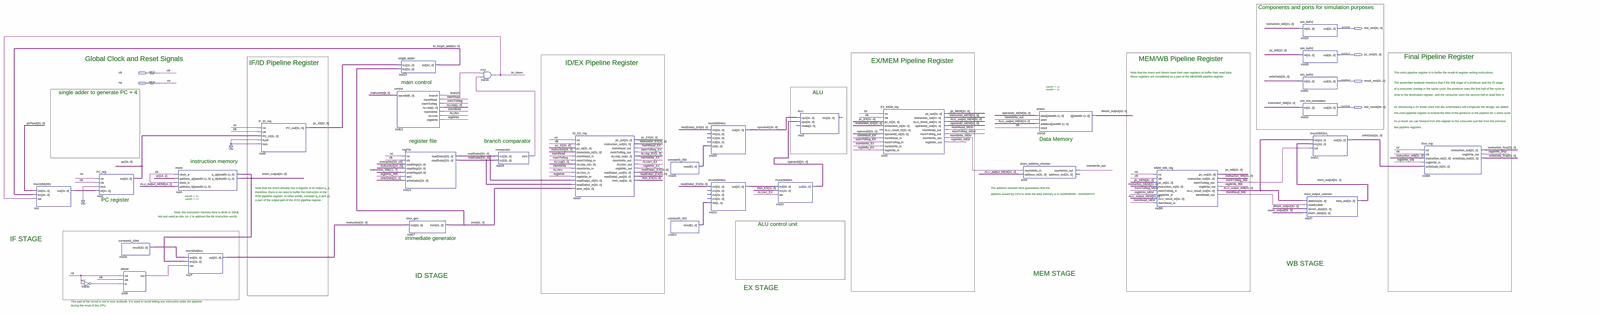
[diagram p0: schematic sheet, whole]
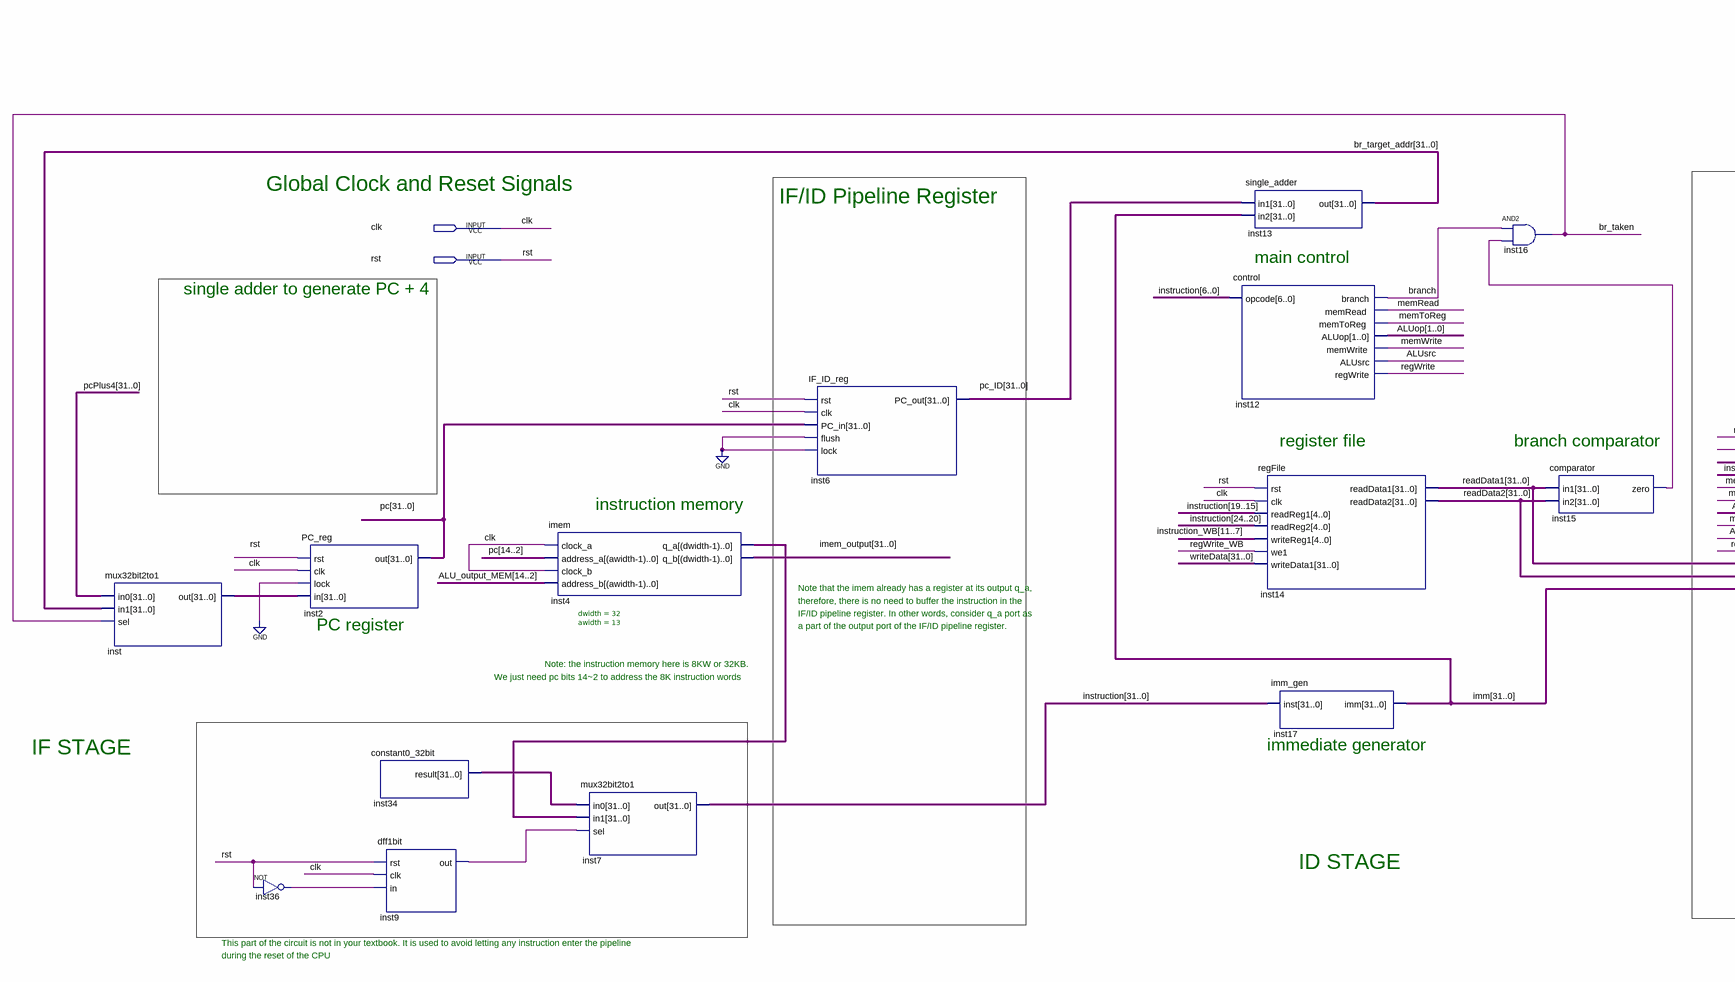
[diagram p1: schematic sheet, left part]
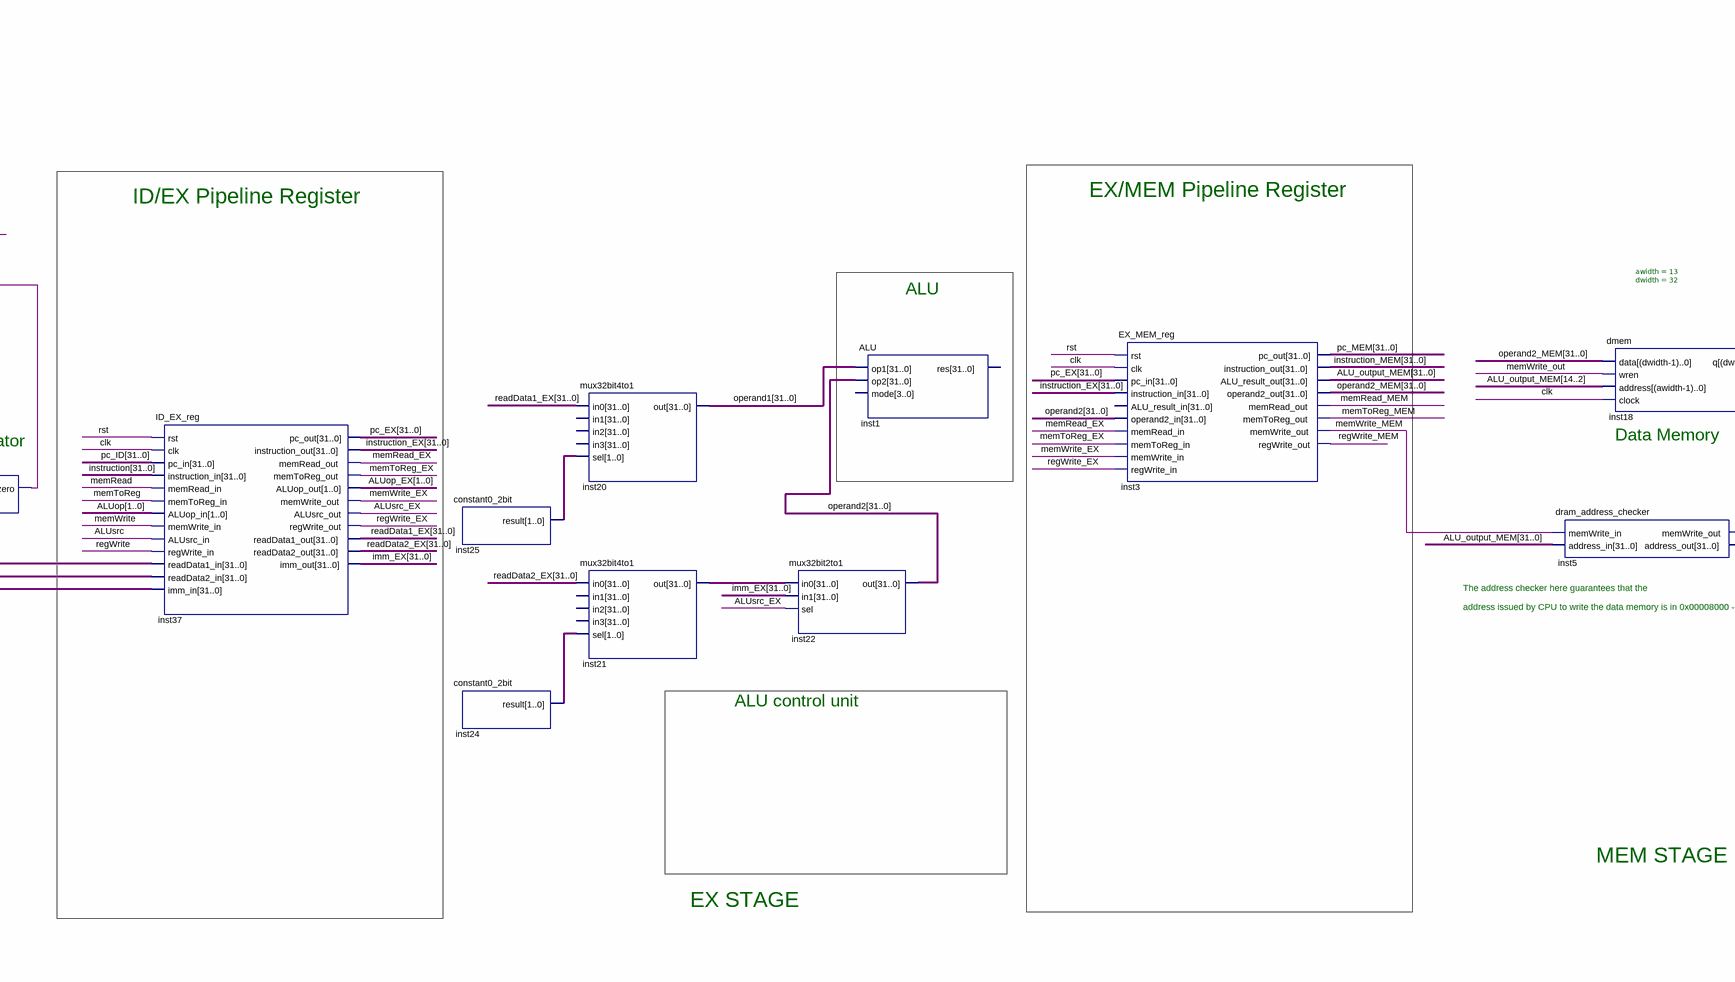
[diagram p2: schematic sheet, centre part]
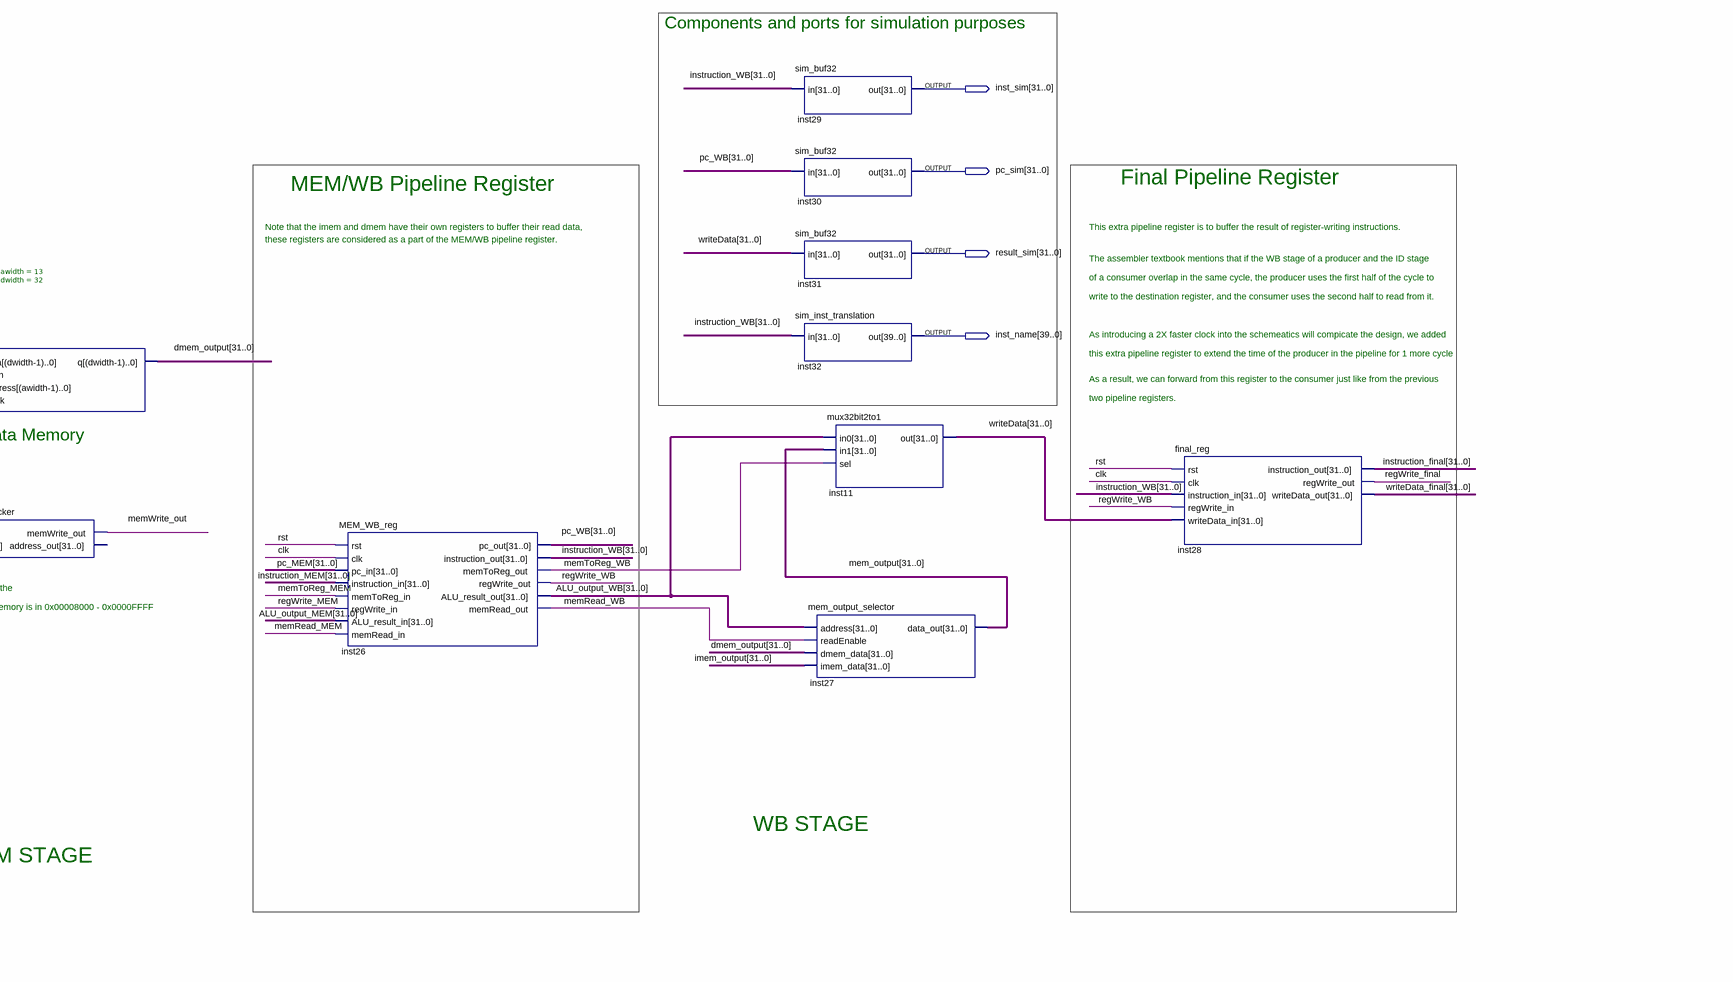
[diagram p3: schematic sheet, right part]
// Quartus schematic cpu.bdf as structural Verilog: 32 symbols, 6 pins
module cpu (
  input  clk,
  input  rst,
  output [31:0] inst_sim,
  output [31:0] pc_sim,
  output [31:0] result_sim,
  output [39:0] inst_name
);

  wire ALUsrc, ALUsrc_EX, br_taken, branch, inst9_out, inst15_zero, inst36_out, memRead, memRead_EX,
       memRead_MEM, memRead_WB, memToReg, memToReg_EX, memToReg_MEM, memToReg_WB, memWrite, memWrite_EX,
       memWrite_MEM, memWrite_out, regWrite, regWrite_EX, regWrite_final, regWrite_MEM, regWrite_WB;
  wire [1:0] ALUop, ALUop_EX, inst24_result, inst25_result;
  wire [31:0] ALU_output_MEM, ALU_output_WB, br_target_addr, dmem_output, imem_output, imm, imm_EX,
       inst4_q_a, inst21_out, inst34_result, inst_out, instruction, instruction_EX, instruction_final,
       instruction_MEM, instruction_WB, mem_output, operand1, operand2, operand2_MEM, pc, pc_EX, pc_ID,
       pc_MEM, pc_WB, pcPlus4, readData1, readData1_EX, readData2, readData2_EX, writeData, writeData_final;

  mux32bit2to1 inst (.in0(pcPlus4), .in1(br_target_addr), .sel(br_taken), .out(inst_out));
  not inst36 (inst36_out, rst);
  PC_reg inst2 (.rst(rst), .clk(clk), .lock(1'b0), .in(inst_out), .out(pc));
  constant0_32bit inst34 (.result(inst34_result));
  dff1bit inst9 (.rst(rst), .clk(clk), .in(inst36_out), .out(inst9_out));
  imem #(.dwidth(32), .awidth(13)) inst4 (
    .clock_a(clk), .address_a(pc[14:2]), .clock_b(clk), .address_b(ALU_output_MEM[14:2]), .q_a(inst4_q_a),
    .q_b(imem_output));
  mux32bit2to1 inst7 (.in0(inst34_result), .in1(inst4_q_a), .sel(inst9_out), .out(instruction));
  IF_ID_reg inst6 (.rst(rst), .clk(clk), .PC_in(pc), .flush(1'b0), .lock(1'b0), .PC_out(pc_ID));
  single_adder inst13 (.in1(pc_ID), .in2(imm), .out(br_target_addr));
  control inst12 (
    .opcode(instruction[6:0]), .branch(branch), .memRead(memRead), .memToReg(memToReg), .ALUop(ALUop),
    .memWrite(memWrite), .ALUsrc(ALUsrc), .regWrite(regWrite));
  regFile inst14 (
    .rst(rst), .clk(clk), .readReg1(instruction[19:15]), .readReg2(instruction[24:20]),
    .writeReg1(instruction_WB[11:7]), .we1(regWrite_WB), .writeData1(writeData), .readData1(readData1),
    .readData2(readData2));
  imm_gen inst17 (.inst(instruction), .imm(imm));
  and inst16 (br_taken, branch, inst15_zero);
  comparator inst15 (.in1(readData1), .in2(readData2), .zero(inst15_zero));
  ID_EX_reg inst37 (
    .rst(rst), .clk(clk), .pc_in(pc_ID), .instruction_in(instruction), .memRead_in(memRead),
    .memToReg_in(memToReg), .ALUop_in(ALUop), .memWrite_in(memWrite), .ALUsrc_in(ALUsrc),
    .regWrite_in(regWrite), .readData1_in(readData1), .readData2_in(readData2), .imm_in(imm), .pc_out(pc_EX),
    .instruction_out(instruction_EX), .memRead_out(memRead_EX), .memToReg_out(memToReg_EX),
    .ALUop_out(ALUop_EX), .memWrite_out(memWrite_EX), .ALUsrc_out(ALUsrc_EX), .regWrite_out(regWrite_EX),
    .readData1_out(readData1_EX), .readData2_out(readData2_EX), .imm_out(imm_EX));
  constant0_2bit inst25 (.result(inst25_result));
  constant0_2bit inst24 (.result(inst24_result));
  mux32bit4to1 inst20 (.in0(readData1_EX), .sel(inst25_result), .out(operand1));  // open: in1, in2, in3
  mux32bit4to1 inst21 (.in0(readData2_EX), .sel(inst24_result), .out(inst21_out));  // open: in1, in2, in3
  mux32bit2to1 inst22 (.in0(inst21_out), .in1(imm_EX), .sel(ALUsrc_EX), .out(operand2));
  ALU inst1 (.op1(operand1), .op2(operand2));  // open: mode, res
  EX_MEM_reg inst3 (
    .rst(rst), .clk(clk), .pc_in(pc_EX), .instruction_in(instruction_EX), .operand2_in(operand2),
    .memRead_in(memRead_EX), .memToReg_in(memToReg_EX), .memWrite_in(memWrite_EX), .regWrite_in(regWrite_EX),
    .pc_out(pc_MEM), .instruction_out(instruction_MEM), .ALU_result_out(ALU_output_MEM),
    .operand2_out(operand2_MEM), .memRead_out(memRead_MEM), .memToReg_out(memToReg_MEM),
    .memWrite_out(memWrite_MEM), .regWrite_out(regWrite_MEM));  // open: ALU_result_in
  dram_address_checker inst5 (
    .memWrite_in(memWrite_MEM), .address_in(ALU_output_MEM), .memWrite_out(memWrite_out));  // open: address_out
  dmem #(.awidth(13), .dwidth(32)) inst18 (
    .data(operand2_MEM), .wren(memWrite_out), .address(ALU_output_MEM[14:2]), .clock(clk), .q(dmem_output));
  MEM_WB_reg inst26 (
    .rst(rst), .clk(clk), .pc_in(pc_MEM), .instruction_in(instruction_MEM), .memToReg_in(memToReg_MEM),
    .regWrite_in(regWrite_MEM), .ALU_result_in(ALU_output_MEM), .memRead_in(memRead_MEM), .pc_out(pc_WB),
    .instruction_out(instruction_WB), .memToReg_out(memToReg_WB), .regWrite_out(regWrite_WB),
    .ALU_result_out(ALU_output_WB), .memRead_out(memRead_WB));
  sim_buf32 inst29 (.in(instruction_WB), .out(inst_sim));
  sim_buf32 inst30 (.in(pc_WB), .out(pc_sim));
  sim_buf32 inst31 (.in(writeData), .out(result_sim));
  sim_inst_translation inst32 (.in(instruction_WB), .out(inst_name));
  mem_output_selector inst27 (
    .address(ALU_output_WB), .readEnable(memRead_WB), .dmem_data(dmem_output), .imem_data(imem_output),
    .data_out(mem_output));
  mux32bit2to1 inst11 (.in0(ALU_output_WB), .in1(mem_output), .sel(memToReg_WB), .out(writeData));
  final_reg inst28 (
    .rst(rst), .clk(clk), .instruction_in(instruction_WB), .regWrite_in(regWrite_WB),
    .writeData_in(writeData), .instruction_out(instruction_final), .regWrite_out(regWrite_final),
    .writeData_out(writeData_final));

  // Notes on the sheet:
  //   Components and ports for simulation purposes
  //   Final Pipeline Register
  //   Global Clock and Reset Signals
  //   MEM/WB Pipeline Register
  //   EX/MEM Pipeline Register
  //   IF/ID Pipeline Register
  //   ID/EX Pipeline Register
  //   Note that the imem and dmem have their own registers to buffer their read data, 
  //   This extra pipeline register is to buffer the result of register-writing instructions. 
  //   these registers are considered as a part of the MEM/WB pipeline register.
  //   main control
  //   The assembler textbook mentions that if the WB stage of a producer and the ID stage
  //   of a consumer overlap in the same cycle, the producer uses the first half of the cycle to
  //   single adder to generate PC + 4
  //   ALU
  //   write to the destination register, and the consumer uses the second half to read from it.
  //   As introducing a 2X faster clock into the schemeatics will compicate the design, we added 
  //   this extra pipeline register to extend the time of the producer in the pipeline for 1 more cycle
  //   As a result, we can forward from this register to the consumer just like from the previous
  //   two pipeline registers.
  //   Data Memory
  //   register file
  //   branch comparator
  //   instruction memory
  //   Note that the imem already has a register at its output q_a, 
  //   The address checker here guarantees that the
  //   therefore, there is no need to buffer the instruction in the 
  //   address issued by CPU to write the data memory is in 0x00008000 - 0x0000FFFF 
  //   IF/ID pipeline register. In other words, consider q_a port as 
  //   PC register
  //   a part of the output port of the IF/ID pipeline register.
  //   Note: the instruction memory here is 8KW or 32KB.
  //   We just need pc bits 14~2 to address the 8K instruction words
  //   ALU control unit
  //   IF STAGE
  //   immediate generator
  //   WB STAGE
  //   MEM STAGE
  //   ID STAGE
  //   EX STAGE
  //   This part of the circuit is not in your textbook. It is used to avoid letting any instruction enter the pipeline
  //   during the reset of the CPU
endmodule
